# Altium schematic sheet schematic pixelated buddy.schdoc
size 185 x 159 mm
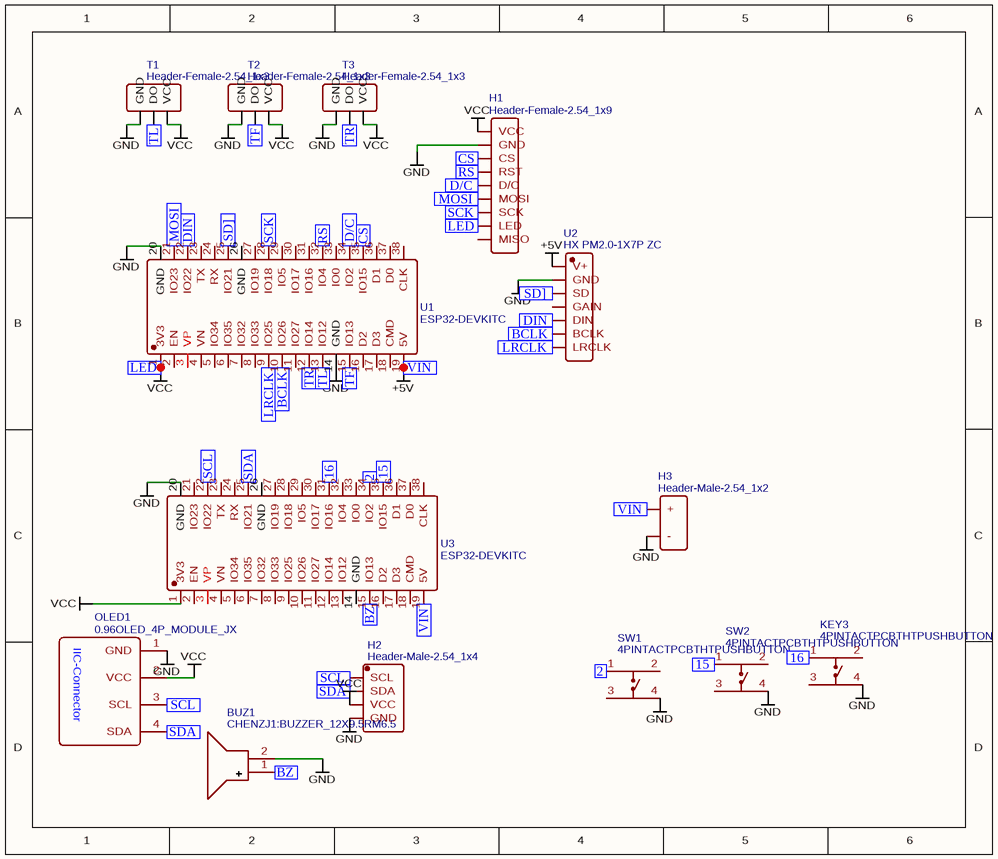
[diagram p0: schematic pixelated buddy.schdoc]

## Parts
BUZ1  CHENZJ1:BUZZER_12X9.5RM6.5  [BUZ-TH_BD12.0-P6.50-D0.6_SEA-1285F]
H1  Header-Female-2.54_1x9  [HDR-TH_9P-P2.54-V-F-1]
H2  Header-Male-2.54_1x4  [HDR-TH_4P-P2.54-V-M]
H3  Header-Male-2.54_1x2  [HDR-TH_2P-P2.54-V-M-1]
KEY3  4PINTACTPCBTHTPUSHBUTTON  [SW-SMD_4P-L6.0-W6.0-P4.50-LS10.0_TL3301EF160QG]
OLED1  0.96OLED_4P_MODULE_JX  [0.96OLED_4P]
SW1  4PINTACTPCBTHTPUSHBUTTON  [SW-SMD_4P-L6.0-W6.0-P4.50-LS10.0_TL3301EF160QG]
SW2  4PINTACTPCBTHTPUSHBUTTON  [SW-SMD_4P-L6.0-W6.0-P4.50-LS10.0_TL3301EF160QG]
T1  Header-Female-2.54_1x3  [HDR-TH_3P-P2.54-V-F]
T2  Header-Female-2.54_1x3  [HDR-TH_3P-P2.54-V-F]
T3  Header-Female-2.54_1x3  [HDR-TH_3P-P2.54-V-F]
U1  ESP32-DEVKITC  [BULETM-SMD_ESP32-DEVKITC]
U2  HX PM2.0-1X7P ZC  [HDR-TH_HX-PM2.0-1X7P-ZC]
U3  ESP32-DEVKITC  [BULETM-SMD_ESP32-DEVKITC]

## Ports
2 (in), 15 (in), 16 (in), BCLK (in), BZ (in), CS (in), D/C (in), DIN (in), LED (in), LRCLK (in), MOSI (in), RS (in), SCK (in), SCL (in), SD] (in), SDA (in), TF (in), TL (in), TR (in), VIN (in)

## Nets
+5V: H3.1(+) U1.19(5V) U2.1(V+) U3.19(5V) ; port VIN
GND: BUZ1.2(-) H1.2(GND) H2.4(GND) H3.2(-) KEY3.4 OLED1.1(GND) SW1.4 SW2.4 T1.1(GND) T2.1(GND) T3.1(GND) U1.14(GND) U1.20(GND) U2.2(GND) U3.20(GND)
VCC: H1.1(VCC) H1.8(LED) H2.3(VCC) OLED1.2(VCC) T1.3(VCC) T2.3(VCC) T3.3(VCC) U1.1(3V3) U3.1(3V3) ; port LED
2: SW1.1 U3.34(IO2) ; port 2
15: SW2.1 U3.35(IO15) ; port 15
16: KEY3.1 U3.31(IO16) ; port 16
BCLK: U1.10(IO26) U2.6(BCLK) ; port BCLK
BZ: BUZ1.1(+) U3.15(IO13) ; port BZ
CS: H1.3(CS) U1.35(IO15) ; port CS
D/C: H1.5(D/C) U1.34(IO2) ; port D/C
DIN: U1.22(IO22) U2.5(DIN) ; port DIN
LRCLK: U1.9(IO25) U2.7(LRCLK) ; port LRCLK
MOSI: H1.6(MOSI) U1.21(IO23) ; port MOSI
RS: H1.4(RST) U1.32(IO4) ; port RS
SCK: H1.7(SCK) U1.28(IO18) ; port SCK
SCL: H2.1(SCL) OLED1.3(SCL) U3.22(IO22) ; port SCL
SD]: U1.25(IO21) U2.3(SD) ; port SD]
SDA: H2.2(SDA) OLED1.4(SDA) U3.25(IO21) ; port SDA
TF: T2.2(DO) U1.15(IO13) ; port TF
TL: T1.2(DO) U1.13(IO12) ; port TL
TR: T3.2(DO) U1.12(IO14) ; port TR

Not connected (* = marked no-connect by the designer): H1 9(MISO); KEY3 2 3; SW1 2 3; SW2 2 3; U1 2(EN) 3(VP) 4(VN) 5(IO34) 6(IO35) 7(IO32) 8(IO33) 11(IO27) 16(D2) 17(D3) 18(CMD) 23(TX) 24(RX) 26(GND) 27(IO19) 29(IO5) 30(IO17) 31(IO16) 33(IO0) 36(D1) 37(D0) 38(CLK); U2 4(GAIN); U3 2(EN) 3(VP) 4(VN) 5(IO34) 6(IO35) 7(IO32) 8(IO33) 9(IO25) 10(IO26) 11(IO27) 12(IO14) 13(IO12) 14(GND) 16(D2) 17(D3) 18(CMD) 21(IO23) 23(TX) 24(RX) 26(GND) 27(IO19) 28(IO18) 29(IO5) 30(IO17) 32(IO4) 33(IO0) 36(D1) 37(D0) 38(CLK)

## Notes on the sheet
- (in symbol 0.96OLED_4P_MODULE_JX) IIC-Connector

## Library data of the parts
BUZ1 = CHENZJ1:BUZZER_12X9.5RM6.5: Manufacturer: null; Contributor: LCSC; Supplier: LCSC; Supplier Part: C9900008742; Manufacturer Part: chenzj1:Buzzer_12x9.5RM6.5; JLCPCB Part Class: Extended Part; spicePre: B; spiceSymbolName: CHENZJ1:BUZZER_12X9.5RM6.5
H1 = Header-Female-2.54_1x9: Manufacturer: BOOMELE(博穆精密); Manufacturer Part: 2.54-1*9P母; Supplier: LCSC; Supplier Part: C39576; JLCPCB Part Class: Extended Part; spicePre: H; spiceSymbolName: Header-Female-2.54_1x9
H2 = Header-Male-2.54_1x4: Manufacturer: Ckmtw(灿科盟); Manufacturer Part: B-2100S04P-A110; Contributor: LCSC; Supplier: LCSC; Supplier Part: C124378; JLCPCB Part Class: Extended Part; spicePre: H; spiceSymbolName: Header-Male-2.54_1x4
H3 = Header-Male-2.54_1x2: Manufacturer: TE Connectivity(泰科电子); Manufacturer Part: 826629-2; Supplier: LCSC; Supplier Part: C86471; JLCPCB Part Class: Extended Part; spicePre: H; spiceSymbolName: Header-Male-2.54_1x2
KEY3 SW1 SW2 = 4PINTACTPCBTHTPUSHBUTTON: Manufacturer: null; Contributor: LCSC; Supplier: LCSC; Supplier Part: C9900003768; Manufacturer Part: 4pinTACTPCBTHTPushButton; JLCPCB Part Class: Extended Part; spicePre: K; spiceSymbolName: 4PINTACTPCBTHTPUSHBUTTON
OLED1 = 0.96OLED_4P_MODULE_JX: Manufacturer: null; Contributor: LCSC; Supplier: LCSC; Supplier Part: C9900004566; Manufacturer Part: 0.96OLED_4P_MODULE_JX; JLCPCB Part Class: Extended Part; spicePre: O; spiceSymbolName: 0.96OLED_4P_MODULE_JX
T1-T3 = Header-Female-2.54_1x3: Manufacturer: BOOMELE(博穆精密); Manufacturer Part: 2.54-1*3P母; Supplier Part: C146243; Supplier: LCSC; JLCPCB Part Class: Extended Part; spicePre: P; spiceSymbolName: Header-Female-2.54_1x3
U1 U3 = ESP32-DEVKITC: Manufacturer: ESPRESSIF(乐鑫); Contributor: lcsc; Supplier: LCSC; Supplier Part: C571180; Manufacturer Part: ESP32-DevKitC; spicePre: U; spiceSymbolName: ESP32-DEVKITC
U2 = HX PM2.0-1X7P ZC: Manufacturer: hanxia(韩下); Contributor: lcsc; Supplier: LCSC; Supplier Part: C22438139; Manufacturer Part: HX PM2.0-1x7P ZC; JLCPCB Part Class: Extended Part; spicePre: U; spiceSymbolName: HX PM2.0-1X7P ZC